# Altium schematic sheet 03_Power tree.SchDoc
size 563 x 386 mm; DsnPath: C:\Users\nilot\Documents\VSCode\SBC\imports\SG2002_QFN88_38_20230301_4L_V1.3_16.2.DSN; SchematicName: CV181xC_QFN88_38_DemoBoard; PageName: 03_Power tree; PageSize: Custom; TopSchematic: True
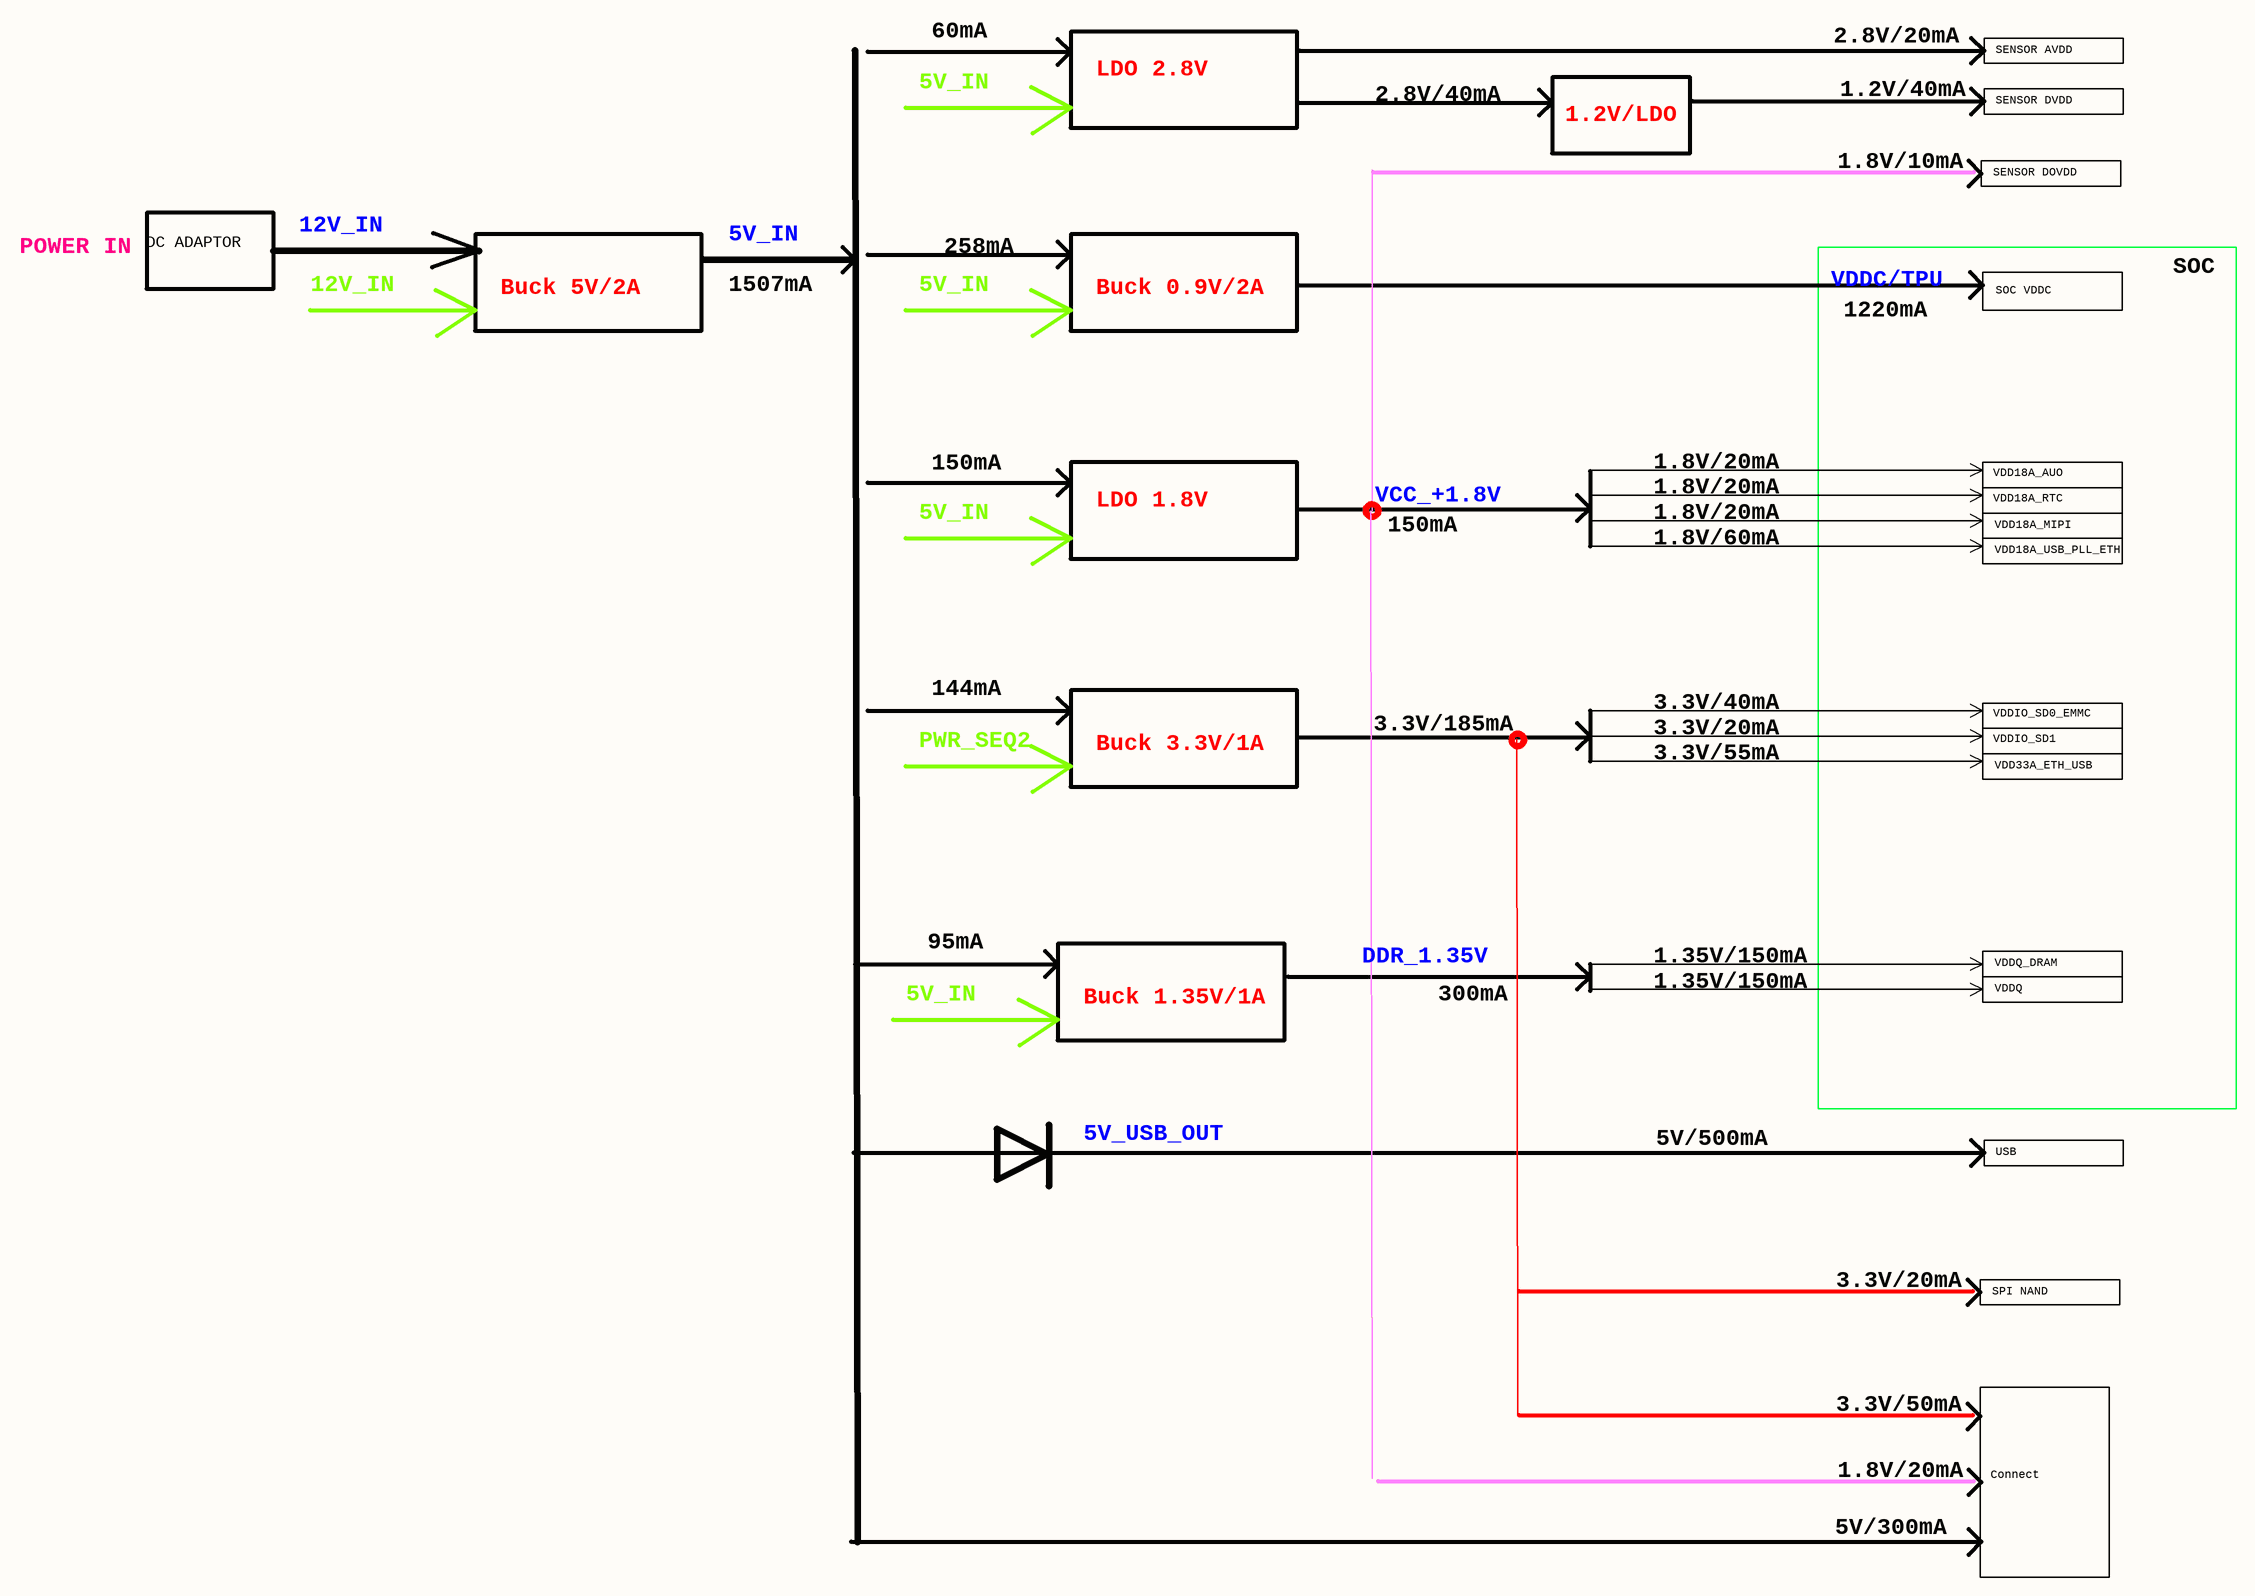
[diagram p0: 03_Power tree.SchDoc]

## Notes on the sheet
- 60mA
- 2.8V/20mA
- SENSOR AVDD
- 5V_IN
- LDO 2.8V
- 2.8V/40mA
- 1.2V/LDO
- 1.2V/40mA
- SENSOR DVDD
- 1.8V/10mA
- SENSOR DOVDD
- POWER IN
- DC ADAPTOR
- 12V_IN
- Buck 5V/2A
- 258mA
- Buck 0.9V/2A
- 1507mA
- VDDC/TPU
- 1220mA
- SOC VDDC
- SOC
- 150mA
- LDO 1.8V
- VCC_+1.8V
- 1.8V/20mA
- VDD18A_RTC
- VDD18A_AUO
- 1.8V/60mA
- VDD18A_MIPI
- VDD18A_USB_PLL_ETH
- 144mA
- Buck 3.3V/1A
- PWR_SEQ2
- 3.3V/185mA
- 3.3V/20mA
- 3.3V/40mA
- 3.3V/55mA
- VDDIO_SD1
- VDDIO_SD0_EMMC
- VDD33A_ETH_USB
- 95mA
- Buck 1.35V/1A
- DDR_1.35V
- 300mA
- 1.35V/150mA
- VDDQ
- VDDQ_DRAM
- 5V_USB_OUT
- 5V/500mA
- USB
- SPI NAND
- 3.3V/50mA
- Connect
- 5V/300mA